# Altium project Sound_Sensor_v3.0.PrjPcb (part 1 of 2)
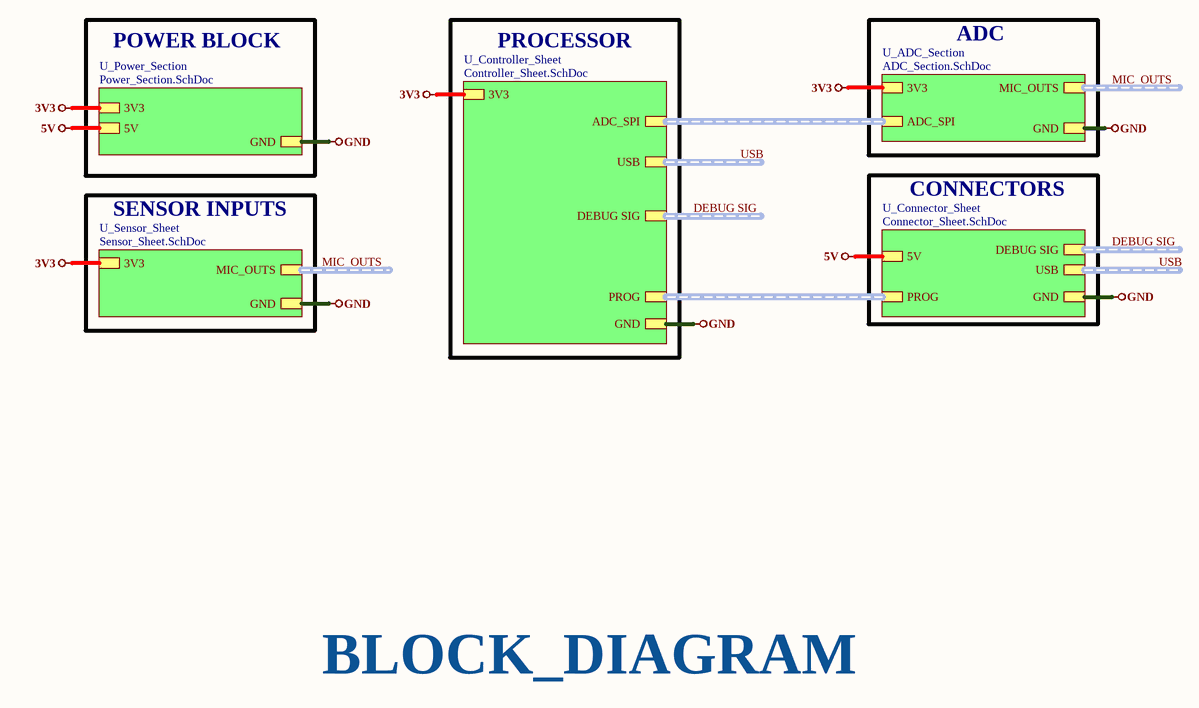
[diagram p0: Top_Sheet.SchDoc]
6 sheets, 83 parts. Net scope: hierarchical (ports join the sheet entries above them; power ports are global).
Board file: Sound_Sensor_v3.0.PcbDoc
Sheets:
  Top_Sheet.SchDoc
    U_Sensor_Sheet = Sensor_Sheet.SchDoc
    U_Power_Section = Power_Section.SchDoc
    U_Controller_Sheet = Controller_Sheet.SchDoc
    U_Connector_Sheet = Connector_Sheet.SchDoc
    U_ADC_Section = ADC_Section.SchDoc

## Sheet Top_Sheet.SchDoc: BLOCK DIAGRAM
size A4; DrawnBy: ENGR ASIM HAYAT; DocumentNumber: 1; SheetNumber: 1; SheetTotal: 6

### Sub-sheets
U_ADC_Section = ADC_Section.SchDoc: MIC_OUTS (harness MIC_OUTS), ADC_SPI (harness ADC_SPI), 3V3, GND
U_Connector_Sheet = Connector_Sheet.SchDoc: PROG (harness PROG), GND, 5V, DEBUG SIG (harness DEBUG SIG), USB (harness USB)
U_Controller_Sheet = Controller_Sheet.SchDoc: PROG (harness PROG), ADC_SPI (harness ADC_SPI), 3V3, GND, DEBUG SIG (harness DEBUG SIG), USB
U_Power_Section = Power_Section.SchDoc: 3V3, GND, 5V
U_Sensor_Sheet = Sensor_Sheet.SchDoc: MIC_OUTS (harness MIC_OUTS), 3V3, GND

### Nets
3V3: sheet U_Sensor_Sheet/3V3, sheet U_Power_Section/3V3, sheet U_Controller_Sheet/3V3, sheet U_ADC_Section/3V3
5V: sheet U_Power_Section/5V, sheet U_Connector_Sheet/5V
GND: sheet U_Sensor_Sheet/GND, sheet U_Power_Section/GND, sheet U_Controller_Sheet/GND, sheet U_Connector_Sheet/GND, sheet U_ADC_Section/GND

### Buses and harness runs
harness DEBUG SIG = sheet U_Connector_Sheet/DEBUG SIG
harness DEBUG SIG = sheet U_Controller_Sheet/DEBUG SIG
harness MIC_OUTS = sheet U_ADC_Section/MIC_OUTS
harness MIC_OUTS = sheet U_Sensor_Sheet/MIC_OUTS
harness sheet U_ADC_Section/ADC_SPI = sheet U_Controller_Sheet/ADC_SPI
harness sheet U_Connector_Sheet/PROG = sheet U_Controller_Sheet/PROG
harness USB = sheet U_Connector_Sheet/USB
harness USB = sheet U_Controller_Sheet/USB

### Notes on the sheet
- POWER BLOCK
- PROCESSOR
- ADC
- SENSOR INPUTS
- CONNECTORS
- BLOCK_DIAGRAM
- File:
- Title:
- Date:
- Page
- Num:
- Total:
- Drawn By: Huzaifa Ali

## Sheet Sensor_Sheet.SchDoc
size A4; DocumentNumber: 3; SheetNumber: 3; SheetTotal: 11
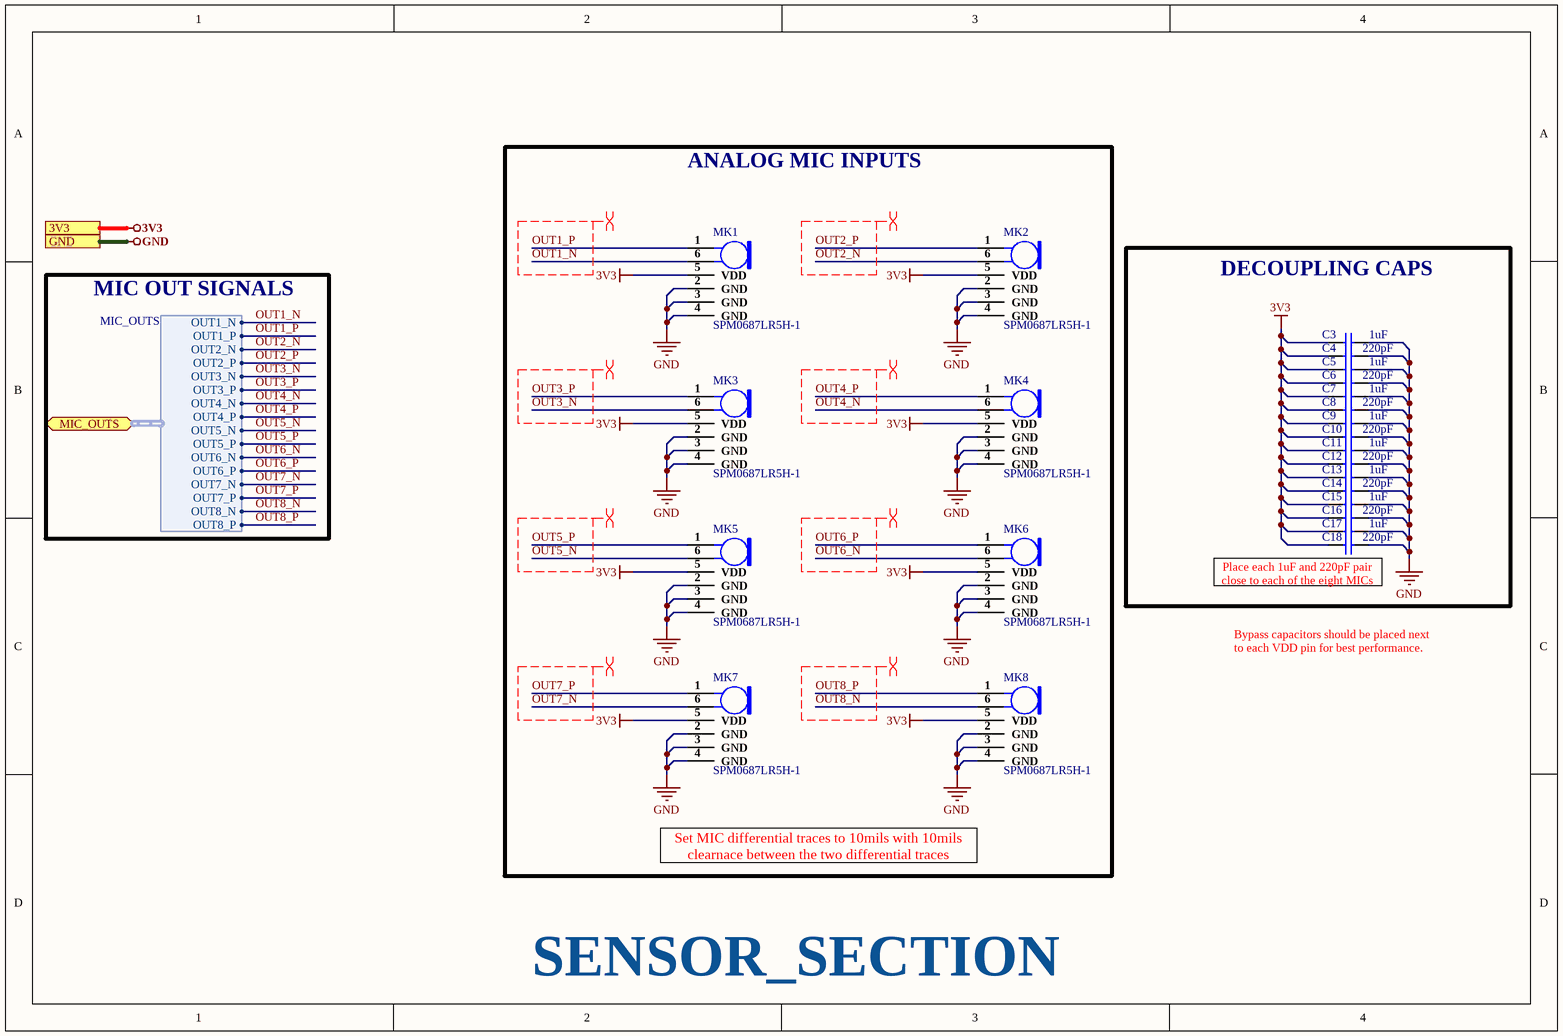
[diagram p1: Sensor_Sheet.SchDoc]

### Parts
C3  1uF  [Cap-0402]
C4  220pF  [Cap 0402]
C5  1uF  [Cap-0402]
C6  220pF  [Cap 0402]
C7  1uF  [Cap-0402]
C8  220pF  [Cap 0402]
C9  1uF  [Cap-0402]
C10  220pF  [Cap 0402]
C11  1uF  [Cap-0402]
C12  220pF  [Cap 0402]
C13  1uF  [Cap-0402]
C14  220pF  [Cap 0402]
C15  1uF  [Cap-0402]
C16  220pF  [Cap 0402]
C17  1uF  [Cap-0402]
C18  220pF  [Cap 0402]
MK1  SPM0687LR5H-1  [SPM0687LR5H-1]
MK2  SPM0687LR5H-1  [SPM0687LR5H-1]
MK3  SPM0687LR5H-1  [SPM0687LR5H-1]
MK4  SPM0687LR5H-1  [SPM0687LR5H-1]
MK5  SPM0687LR5H-1  [SPM0687LR5H-1]
MK6  SPM0687LR5H-1  [SPM0687LR5H-1]
MK7  SPM0687LR5H-1  [SPM0687LR5H-1]
MK8  SPM0687LR5H-1  [SPM0687LR5H-1]

### Blocks framed on the sheet
ANALOG MIC INPUTS: MK1-MK8
DECOUPLING CAPS: C3-C18

### Ports
3V3, GND, MIC_OUTS (bidir, harness MIC_OUTS)

### Harnesses
MIC_OUTS: OUT1_N, OUT1_P, OUT2_N, OUT2_P, OUT3_N, OUT3_P, OUT4_N, OUT4_P, OUT5_N, OUT5_P, OUT6_N, OUT6_P, OUT7_N, OUT7_P, OUT8_N, OUT8_P

### Nets
3V3: C3.1 C4.1 C5.1 C6.1 C7.1 C8.1 C9.1 C10.1 C11.1 C12.1 C13.1 C14.1 C15.1 C16.1 C17.1 C18.1 MK1.5(VDD) MK2.5(VDD) MK3.5(VDD) MK4.5(VDD) MK5.5(VDD) MK6.5(VDD) MK7.5(VDD) MK8.5(VDD) ; port 3V3
GND: C3.2 C4.2 C5.2 C6.2 C7.2 C8.2 C9.2 C10.2 C11.2 C12.2 C13.2 C14.2 C15.2 C16.2 C17.2 C18.2 MK1.2(GND) MK1.3(GND) MK1.4(GND) MK2.2(GND) MK2.3(GND) MK2.4(GND) MK3.2(GND) MK3.3(GND) MK3.4(GND) MK4.2(GND) MK4.3(GND) MK4.4(GND) MK5.2(GND) MK5.3(GND) MK5.4(GND) MK6.2(GND) MK6.3(GND) MK6.4(GND) MK7.2(GND) MK7.3(GND) MK7.4(GND) MK8.2(GND) MK8.3(GND) MK8.4(GND) ; port GND
OUT1_N: MK1.6(OUT-) ; port MIC_OUTS.OUT1_N  [project net MIC_OUTS.OUT1_N]
OUT1_P: MK1.1(OUT+) ; port MIC_OUTS.OUT1_P  [project net MIC_OUTS.OUT1_P]
OUT2_N: MK2.6(OUT-) ; port MIC_OUTS.OUT2_N  [project net MIC_OUTS.OUT2_N]
OUT2_P: MK2.1(OUT+) ; port MIC_OUTS.OUT2_P  [project net MIC_OUTS.OUT2_P]
OUT3_N: MK3.6(OUT-) ; port MIC_OUTS.OUT3_N  [project net MIC_OUTS.OUT3_N]
OUT3_P: MK3.1(OUT+) ; port MIC_OUTS.OUT3_P  [project net MIC_OUTS.OUT3_P]
OUT4_N: MK4.6(OUT-) ; port MIC_OUTS.OUT4_N  [project net MIC_OUTS.OUT4_N]
OUT4_P: MK4.1(OUT+) ; port MIC_OUTS.OUT4_P  [project net MIC_OUTS.OUT4_P]
OUT5_N: MK5.6(OUT-) ; port MIC_OUTS.OUT5_N  [project net MIC_OUTS.OUT5_N]
OUT5_P: MK5.1(OUT+) ; port MIC_OUTS.OUT5_P  [project net MIC_OUTS.OUT5_P]
OUT6_N: MK6.6(OUT-) ; port MIC_OUTS.OUT6_N  [project net MIC_OUTS.OUT6_N]
OUT6_P: MK6.1(OUT+) ; port MIC_OUTS.OUT6_P  [project net MIC_OUTS.OUT6_P]
OUT7_N: MK7.6(OUT-) ; port MIC_OUTS.OUT7_N  [project net MIC_OUTS.OUT7_N]
OUT7_P: MK7.1(OUT+) ; port MIC_OUTS.OUT7_P  [project net MIC_OUTS.OUT7_P]
OUT8_N: MK8.6(OUT-) ; port MIC_OUTS.OUT8_N  [project net MIC_OUTS.OUT8_N]
OUT8_P: MK8.1(OUT+) ; port MIC_OUTS.OUT8_P  [project net MIC_OUTS.OUT8_P]

### Layout directives
differential pair; net class OUT1; differential pair class OUT1_Lines; rule Matched Net Lengths [Tolerance = 20mil]; rule Impedance Constraint [Min = 85.00    Max = 95.00    ]: OUT1_N, OUT1_P
differential pair; net class OUT3; differential pair class OUT3_Lines; rule Matched Net Lengths [Tolerance = 20mil]; rule Impedance Constraint [Min = 85.00    Max = 95.00    ]: OUT3_N, OUT3_P
differential pair; net class OUT5; differential pair class OUT5_Lines; rule Matched Net Lengths [Tolerance = 20mil]; rule Impedance Constraint [Min = 85.00    Max = 95.00    ]: OUT5_N, OUT5_P
differential pair; net class OUT7; differential pair class OUT7_Lines; rule Matched Net Lengths [Tolerance = 20mil]; rule Impedance Constraint [Min = 85.00    Max = 95.00    ]: OUT7_N, OUT7_P
differential pair; net class OUT8; differential pair class OUT8_Lines; rule Matched Net Lengths [Tolerance = 20mil]; rule Impedance Constraint [Min = 85.00    Max = 95.00    ]: OUT8_N, OUT8_P
differential pair; net class OUT6; differential pair class OUT6_Lines; rule Matched Net Lengths [Tolerance = 20mil]; rule Impedance Constraint [Min = 85.00    Max = 95.00    ]: OUT6_N, OUT6_P
differential pair; net class OUT4; differential pair class OUT4_Lines; rule Matched Net Lengths [Tolerance = 20mil]; rule Impedance Constraint [Min = 85.00    Max = 95.00    ]: OUT4_N, OUT4_P
differential pair; net class OUT2; differential pair class OUT2_Lines; rule Matched Net Lengths [Tolerance = 20mil]; rule Impedance Constraint [Min = 85.00    Max = 95.00    ]: OUT2_N, OUT2_P

### Notes on the sheet
- MIC OUT SIGNALS
- (near C18) Place each 1uF and 220pF pair close to each of the eight MICs
- Bypass capacitors should be placed next to each VDD pin for best performance.
- Set MIC differential traces to 10mils with 10mils clearnace between the two differential traces
- SENSOR_SECTION
- File:
- Title:
- Date:
- Page
- Num:
- Total:
- Drawn By: Huzaifa Ali

### Library data of the parts
C3 C5 C7 C9 C11 C13 C15 C17 = CC0402KRX5R8BB105: CAP CER 1UF 25V X5R 0402; Manufacturer: Yageo; Tolerance: 10%; Supplier 1: Mouser; Manufacturer Part Number: CC0402KRX5R8BB105; RoHS: Yes; Category: Ceramic Capacitors; Stock 1: 91975; Pricing 1: 1=0.30000, 10=0.20400, 50=0.20400, 100=0.11600, 1000=0.07200, 10000=0.05900 (USD); Mount: Surface Mount; Case/Package: 0402; Case Code (Metric): 1005; Case Code (Imperial): 0402; Weight: 2.3E-05oz; Min Operating Temperature: -55°C; Max Operating Temperature: 85°C; Packaging: Tape and Reel; Capacitance: 1uF; Voltage Rating: 25V; Dielectric: X5R; Termination: SMD/SMT; Voltage Rating (DC): 25V; Package Quantity: 10000; Length: 0.039inch; Width: 0.02inch; Thickness: 0.022inch; Lead Free: Lead Free; Halogen Free: Halogen Free; RoHS Compliant: Yes; ComponentLink1URL: http://www.mouser.com/ds/2/447/Yageo_UPY-GP_NP0_16V-to-50V_9-358835.pdf?src-supplier=Mouser; ComponentLink1Description: http://www.mouser.com/ds/2/447/Yageo_UPY-GP_NP0_16V-to-50V_9-358835.pdf?src-supplier=Mouser; ComponentLink2URL: http://www.yageo.com/documents/recent/UPY-GPHC_X5R_4V-to-50V_25.pdf?src-supplier=Digi-Key; ComponentLink2Description: http://www.yageo.com/documents/recent/UPY-GPHC_X5R_4V-to-50V_25.pdf?src-supplier=Digi-Key; ComponentLink3URL: https://4donline.ihs.com/images/VipMasterIC/IC/YAGO/YAGO-S-A0006851646/YAGO-S-A0006851646-1.pdf?hkey=6D3A4C79FDBF58556ACFDE234799DDF0&src-supplier=Newark; ComponentLink3Description: https://4donline.ihs.com/images/VipMasterIC/IC/YAGO/YAGO-S-A0006851646/YAGO-S-A0006851646-1.pdf?hkey=6D3A4C79FDBF58556ACFDE234799DDF0&src-supplier=Newark; Supplier Part Number 1: 603-CC402KRX5R8BB105; LCSC Part Number: C326568
C4 C6 C8 C10 C12 C14 C16 C18 = CC0402JRNPO9BN221: CAP CER 220PF 50V C0G/NPO 0402; Manufacturer: Yageo; Dielectric Material: Ceramic; Tolerance: 10%; Dielectric: C0G; Temperature Coefficient: 30ppm/°C; Insulation Resistance: 10GR; Dissipation Factor: 0.1%; Supplier 1: RSComponents; Manufacturer Part Number: CC0402JRNPO9BN221; RoHS: Yes; Category: Ceramic Capacitors; Stock 1: 20000; Pricing 1: 10000=0.00600, 100000=0.00600 (GBP); Mount: Surface Mount; Case/Package: 0402; Number of Pins: 2; Case Code (Metric): 1005; Case Code (Imperial): 0402; Min Operating Temperature: -55°C; Max Operating Temperature: 125°C; Capacitance: 220pF; Package Quantity: 1; Voltage Rating: 50V; Packaging: Tape and Reel; Termination: SMD/SMT; Voltage: 50V; Series: CC; Length: 1mm; Width: 0.02inch; Height: 0.5mm; Thickness: 0.022inch; Depth: 0.5mm; Radiation Hardening: No; RoHS Compliant: Yes; REACH SVHC: No SVHC; Lead Free: Lead Free; ComponentLink1URL: https://datasheet.ciiva.com/11786/0900766b8079c870-11786154.pdf?src-supplier=RSComponents; ComponentLink1Description: https://datasheet.ciiva.com/11786/0900766b8079c870-11786154.pdf?src-supplier=RSComponents; ComponentLink2URL: https://datasheet.ciiva.com/7656/1132289-7656616.pdf?src-supplier=Element14; ComponentLink2Description: https://datasheet.ciiva.com/7656/1132289-7656616.pdf?src-supplier=Element14; ComponentLink3URL: https://datasheet.ciiva.com/8033/1443161-8033609.pdf?src-supplier=Element14; ComponentLink3Description: https://datasheet.ciiva.com/8033/1443161-8033609.pdf?src-supplier=Element14; ComponentLink4URL: https://datasheet.ciiva.com/8033/1443161-8033608.pdf?src-supplier=Element14; ComponentLink4Description: https://datasheet.ciiva.com/8033/1443161-8033608.pdf?src-supplier=Element14; ComponentLink5URL: https://datasheet.ciiva.com/176/mlccorderingcode-176384.pdf?src-supplier=Digi-Key; ComponentLink5Description: https://datasheet.ciiva.com/176/mlccorderingcode-176384.pdf?src-supplier=Digi-Key; ComponentLink6URL: https://datasheet.ciiva.com/176/mlccorderingcode-176383.pdf?src-supplier=Digi-Key; ComponentLink6Description: https://datasheet.ciiva.com/176/mlccorderingcode-176383.pdf?src-supplier=Digi-Key; ComponentLink7URL: https://datasheet.ciiva.com/176/mlccorderingcode-176385.pdf?src-supplier=Digi-Key; ComponentLink7Description: https://datasheet.ciiva.com/176/mlccorderingcode-176385.pdf?src-supplier=Digi-Key; ComponentLink8URL: https://datasheet.ciiva.com/17434/upy-gp-np0-16v-to-50v-8-17434343.pdf?src-supplier=Avnet+Europe; ComponentLink8Description: https://datasheet.ciiva.com/17434/upy-gp-np0-16v-to-50v-8-17434343.pdf?src-supplier=Avnet+Europe; Supplier Part Number 1: 6169284
MK1-MK8 = SPM0687LR5H-1: WINFREY MIC HI SNR/AOP BOT PORT; Manufacturer: Knowles; Shape: Rectangular; Output Type: Analog; Operating Supply Current: 285uA; Item Type: Microphone; Supplier 1: Digi-Key; Manufacturer Part Number: SPM0687LR5H-1; RoHS: Yes; Category: Microphones; Stock 1: 116440; Pricing 1: 1=2.12000, 10=1.75900, 25=1.62560, 50=1.52880, 100=1.43540, 500=1.23212, 1000=1.17611 (USD); Packaging: Cut Tape; Termination: Solder; ComponentLink1URL: https://media.digikey.com/pdf/Data%20Sheets/Knowles%20Acoustics%20PDFs/SPM0687LR5H-1.pdf?src-supplier=Digi-Key; ComponentLink1Description: https://media.digikey.com/pdf/Data%20Sheets/Knowles%20Acoustics%20PDFs/SPM0687LR5H-1.pdf?src-supplier=Digi-Key; Supplier Part Number 1: 423-SPM0687LR5H-1CT-ND; LCSC Part Number: *

## Sheet Power_Section.SchDoc
size A4; DocumentNumber: 2; SheetNumber: 2; SheetTotal: 11
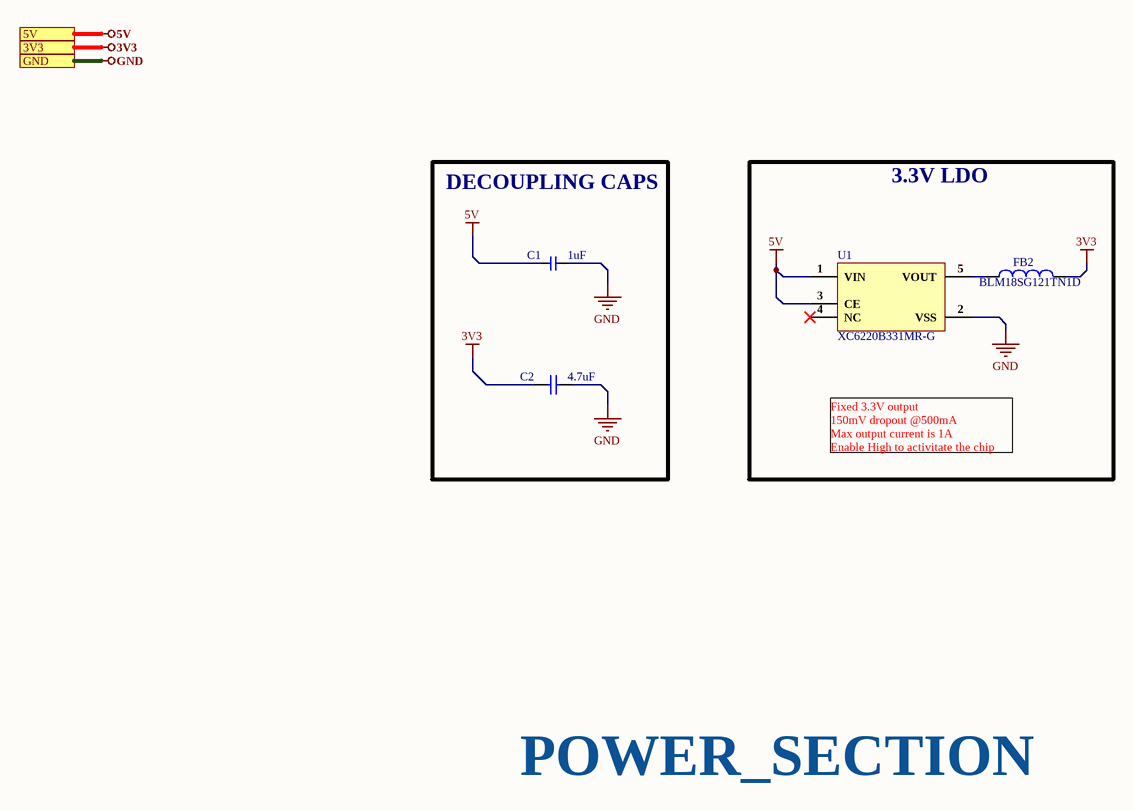
[diagram p2: Power_Section.SchDoc]

### Parts
C1  1uF  [Cap-0603]
C2  4.7uF  [Cap-0603]
FB2  BLM18SG121TN1D  [IND-0603 (1608 Metric)]
U1  XC6220B331MR-G  [SOT-25]

### Blocks framed on the sheet
DECOUPLING CAPS: C1 C2
3.3V LDO: FB2 U1

### Ports
3V3, 5V, GND

### Nets
3V3: C2.1 FB2.2 ; port 3V3
5V: C1.1 U1.1(VIN) U1.3(CE) ; port 5V
GND: C1.2 C2.2 U1.2(VSS) ; port GND
NetFB2_1: FB2.1 U1.5(VOUT)

Not connected (* = marked no-connect by the designer): U1 4(NC)*

### Notes on the sheet
- Fixed 3.3V output
  150mV dropout @500mA
  Max output current is 1A
  Enable High to activitate the chip
- POWER_SECTION
- File:
- Title:
- Date:
- Page
- Num:
- Total:
- Drawn By: Huzaifa Ali

### Library data of the parts
C1 = CC0603KRX5R8BB105: CAP CER 1UF 25V X5R 0603; Manufacturer: Yageo; Tolerance: 10%; Item Type: Capacitor; Supplier 1: Digi-Key; Manufacturer Part Number: CC0603KRX5R8BB105; RoHS: Yes; Category: Ceramic Capacitors; Stock 1: 919939; Pricing 1: 1=0.12000, 10=0.08400, 50=0.04760, 100=0.03940, 500=0.02764, 1000=0.02288 (USD); Mount: Surface Mount; Case/Package: 0603; Case Code (Metric): 1608; Case Code (Imperial): 0603; Min Operating Temperature: -55°C; Max Operating Temperature: 85°C; Packaging: Tape and Reel; Capacitance: 1uF; Voltage Rating: 25V; Dielectric: X5R; Termination: SMD/SMT; Voltage Rating (DC): 25V; Package Quantity: 1; Length: 1.6mm; Width: 0.031inch; Thickness: 0.035inch; Lead Free: Lead Free; Halogen Free: Halogen Free; RoHS Compliant: Yes; ComponentLink1URL: https://datasheet.ciiva.com/176/mlccorderingcode-176785.pdf?src-supplier=Digi-Key; ComponentLink1Description: https://datasheet.ciiva.com/176/mlccorderingcode-176785.pdf?src-supplier=Digi-Key; ComponentLink2URL: https://datasheet.ciiva.com/176/mlccorderingcode-176786.pdf?src-supplier=Digi-Key; ComponentLink2Description: https://datasheet.ciiva.com/176/mlccorderingcode-176786.pdf?src-supplier=Digi-Key; ComponentLink3URL: https://datasheet.ciiva.com/176/mlccorderingcode-176787.pdf?src-supplier=Digi-Key; ComponentLink3Description: https://datasheet.ciiva.com/176/mlccorderingcode-176787.pdf?src-supplier=Digi-Key; Supplier Part Number 1: 311-1445-1-ND; LCSC Part Number: C14664; Number of Pins: 2; Series: CC; Construction: Flat; Height: 0.8mm; Depth: 0.8mm; Radiation Hardening: No; REACH SVHC: No SVHC; ComponentLink4URL: https://datasheet.ciiva.com/17436/upy-gphc-x5r-4v-to-50v-12-17436952.pdf?src-supplier=Avnet+Europe; ComponentLink4Description: https://datasheet.ciiva.com/17436/upy-gphc-x5r-4v-to-50v-12-17436952.pdf?src-supplier=Avnet+Europe; ComponentLink5URL: https://datasheet.ciiva.com/7978/1525783-7978171.pdf?src-supplier=Element14; ComponentLink5Description: https://datasheet.ciiva.com/7978/1525783-7978171.pdf?src-supplier=Element14; ComponentLink6URL: https://datasheet.ciiva.com/11586/upy-gphc-x5r-4v-to-50v-12-11586318.pdf?src-supplier=Avnet; ComponentLink6Description: https://datasheet.ciiva.com/11586/upy-gphc-x5r-4v-to-50v-12-11586318.pdf?src-supplier=Avnet
C2 = CC0603KRX5R7BB475: CAP CER 4.7UF 16V X5R 0603; Manufacturer: Yageo; Tolerance: 10%; Supplier 1: Digi-Key; Manufacturer Part Number: CC0603KRX5R7BB475; RoHS: Yes; Category: Ceramic Capacitors; Stock 1: 547703; Pricing 1: 1=0.20000, 10=0.13800, 50=0.08280, 100=0.06990, 500=0.04784, 1000=0.04233 (USD); Mount: Surface Mount; Case/Package: 0603; Case Code (Imperial): 0603; Case Code (Metric): 1608; Weight: 7.1E-05oz; Min Operating Temperature: -55°C; Max Operating Temperature: 85°C; Capacitance: 4.7uF; Voltage Rating: 16V; Voltage Rating (DC): 16V; Packaging: Tape and Reel; Dielectric: X5R; Termination: SMD/SMT; Resistor Type: Ceramic; Series: CC; Length: 1.6mm; Width: 0.8mm; Height: 0.8mm; Thickness: 0.037inch; Depth: 0.8mm; Lead Free: Lead Free; Halogen Free: Halogen Free; RoHS Compliant: Yes; ComponentLink1URL: http://www.mouser.com/ds/2/447/UPY-GPHC_X5R_4V-to-50V_25-1131599.pdf?src-supplier=Mouser; ComponentLink1Description: http://www.mouser.com/ds/2/447/UPY-GPHC_X5R_4V-to-50V_25-1131599.pdf?src-supplier=Mouser; ComponentLink2URL: http://www.yageo.com/documents/recent/UPY-GPHC_X5R_4V-to-50V_25.pdf?src-supplier=Digi-Key; ComponentLink2Description: http://www.yageo.com/documents/recent/UPY-GPHC_X5R_4V-to-50V_25.pdf?src-supplier=Digi-Key; Supplier Part Number 1: 311-1785-1-ND; LCSC Part Number: C277476
FB2 = BLM18SG121TN1D: FERRITE BEAD 120 OHM 0603 1LN; Manufacturer: Murata; Material: Steel,Ferrite; Tolerance: 25%; Impedance: 120R; DC Resistance (DCR): 25mR; Max DC Current: 3A; Number of Lines: 1; Test Frequency: 100MHz; Shielding: Unshielded; Supplier 1: Arrow Electronics; Manufacturer Part Number: BLM18SG121TN1D; RoHS: Yes; Category: Ferrite Beads and Chips; Stock 1: 82612; Pricing 1: 1=0.12640, 10=0.08350, 25=0.07210, 100=0.05150, 250=0.04730, 500=0.04110, 1000=0.03420, 3000=0.03360, 6000=0.03320, 15000=0.03270, 30000=0.03200, 75000=0.03150 (USD); Case/Package: 0603; Number of Pins: 2; Core Material: Ferrite; Case Code (Metric): 1608; Case Code (Imperial): 0603; Min Operating Temperature: -55°C; Max Operating Temperature: 125°C; Package Quantity: 1; Max Current Rating: 3A; Packaging: Tape and Reel; Current Rating: 3A; Termination: SMD/SMT; Frequency: 100MHz; Number of Circuits: 1; Series: BLM18S; DC Resistance-Max: 25mR; Length: 1.6mm; Width: 0.8mm; Height: 0.8mm; Depth: 0.8mm; Reach SVHC Compliant: Yes; Lead Free: Lead Free; RoHS Compliant: Yes; ComponentLink1URL: https://datasheet.ciiva.com/1012/l0110s0100blm18s-1012624.pdf?src-supplier=Digi-Key; ComponentLink1Description: https://datasheet.ciiva.com/1012/l0110s0100blm18s-1012624.pdf?src-supplier=Digi-Key; ComponentLink2URL: https://datasheet.ciiva.com/11799/0900766b811b5866-11799181.pdf?src-supplier=RSComponents; ComponentLink2Description: https://datasheet.ciiva.com/11799/0900766b811b5866-11799181.pdf?src-supplier=RSComponents; ComponentLink3URL: https://datasheet.ciiva.com/18093/getdatasheetpartid-295885-18093249.pdf?src-supplier=Verical; ComponentLink3Description: https://datasheet.ciiva.com/18093/getdatasheetpartid-295885-18093249.pdf?src-supplier=Verical; ComponentLink4URL: https://datasheet.ciiva.com/41449/001171723-da-01-en-chip-drossel0603-120r-3000ma-1-6x0-8mm-41449353.pdf?src-supplier=Conrad; ComponentLink4Description: https://datasheet.ciiva.com/41449/001171723-da-01-en-chip-drossel0603-120r-3000ma-1-6x0-8mm-41449353.pdf?src-supplier=Conrad; ComponentLink5URL: https://datasheet.ciiva.com/41449/001172312-da-01-en-drossel-0603-120r-1-6x0-8mm-10000st-41449675.pdf?src-supplier=Conrad; ComponentLink5Description: https://datasheet.ciiva.com/41449/001172312-da-01-en-drossel-0603-120r-1-6x0-8mm-10000st-41449675.pdf?src-supplier=Conrad; ComponentLink6URL: https://datasheet.ciiva.com/8021/5151-8021511.pdf?src-supplier=Element14; ComponentLink6Description: https://datasheet.ciiva.com/8021/5151-8021511.pdf?src-supplier=Element14; ComponentLink7URL: https://datasheet.ciiva.com/8021/5151-8021512.pdf?src-supplier=Element14; ComponentLink7Description: https://datasheet.ciiva.com/8021/5151-8021512.pdf?src-supplier=Element14; ComponentLink8URL: https://datasheet.ciiva.com/14122/blm-series-eng-tds-14122906.pdf?src-supplier=Distrelec; ComponentLink8Description: https://datasheet.ciiva.com/14122/blm-series-eng-tds-14122906.pdf?src-supplier=Distrelec; ComponentLink9URL: https://datasheet.ciiva.com/1012/l0110s0100blm18s-1012623.pdf?src-supplier=Digi-Key; ComponentLink9Description: https://datasheet.ciiva.com/1012/l0110s0100blm18s-1012623.pdf?src-supplier=Digi-Key; ComponentLink10URL: https://datasheet.ciiva.com/1012/l0110s0100blm18s-1012625.pdf?src-supplier=Digi-Key; ComponentLink10Description: https://datasheet.ciiva.com/1012/l0110s0100blm18s-1012625.pdf?src-supplier=Digi-Key; ComponentLink11URL: https://datasheet.ciiva.com/16395/l0110s0100blm18s-16395498.pdf?src-supplier=Future+Electronics; ComponentLink11Description: https://datasheet.ciiva.com/16395/l0110s0100blm18s-16395498.pdf?src-supplier=Future+Electronics; Supplier Part Number 1: BLM18SG121TN1D; LCSC Part Number: C113030; Item Type: Ferrite Bead
U1 = XC6220B331MR-G: Linear Voltage Regulator IC Positive Fixed 1 Output 3.3V 1A SOT-25; Manufacturer: Torex; Dropout Voltage: 655mV; Min Input Voltage: 1.6V; Max Input Voltage: 6V; Number of Regulators: 1; Min Current Limit: 1.005A; Supplier 1: Newark; Manufacturer Part Number: XC6220B331MR-G; RoHS: Yes; Category: Voltage Regulators - Linear; Stock 1: 3078; Pricing 1: 1=1.20000, 10=1.08000, 100=0.83900, 500=0.69300, 1000=0.54800 (USD); Mount: Surface Mount; Case/Package: SOT-25; Number of Pins: 5; Min Operating Temperature: -40°C; Max Operating Temperature: 85°C; Package Quantity: 1; Packaging: Tape and Reel; Output Current: 1A; Output Voltage: 3.3V; Nominal Output Voltage: 3.3V; Output Type: Fixed; Series: -; REACH SVHC: No SVHC; RoHS Compliant: Yes; ComponentLink1URL: https://datasheet.ciiva.com/7992/610888-7992813.pdf?src-supplier=Element14; ComponentLink1Description: https://datasheet.ciiva.com/7992/610888-7992813.pdf?src-supplier=Element14; ComponentLink2URL: https://datasheet.ciiva.com/5755/610888-5755886.pdf?src-supplier=Farnell; ComponentLink2Description: https://datasheet.ciiva.com/5755/610888-5755886.pdf?src-supplier=Farnell; ComponentLink3URL: https://datasheet.ciiva.com/2040/xc6220-2040201.pdf?src-supplier=Digi-Key; ComponentLink3Description: https://datasheet.ciiva.com/2040/xc6220-2040201.pdf?src-supplier=Digi-Key; ComponentLink4URL: https://datasheet.ciiva.com/2040/xc6220-2040200.pdf?src-supplier=Digi-Key; ComponentLink4Description: https://datasheet.ciiva.com/2040/xc6220-2040200.pdf?src-supplier=Digi-Key; ComponentLink5URL: https://datasheet.ciiva.com/2040/xc6220-2040202.pdf?src-supplier=Digi-Key; ComponentLink5Description: https://datasheet.ciiva.com/2040/xc6220-2040202.pdf?src-supplier=Digi-Key; Supplier Part Number 1: 84R0738

## Sheet Controller_Sheet.SchDoc
size A4; DocumentNumber: 5; SheetNumber: 5; SheetTotal: 11
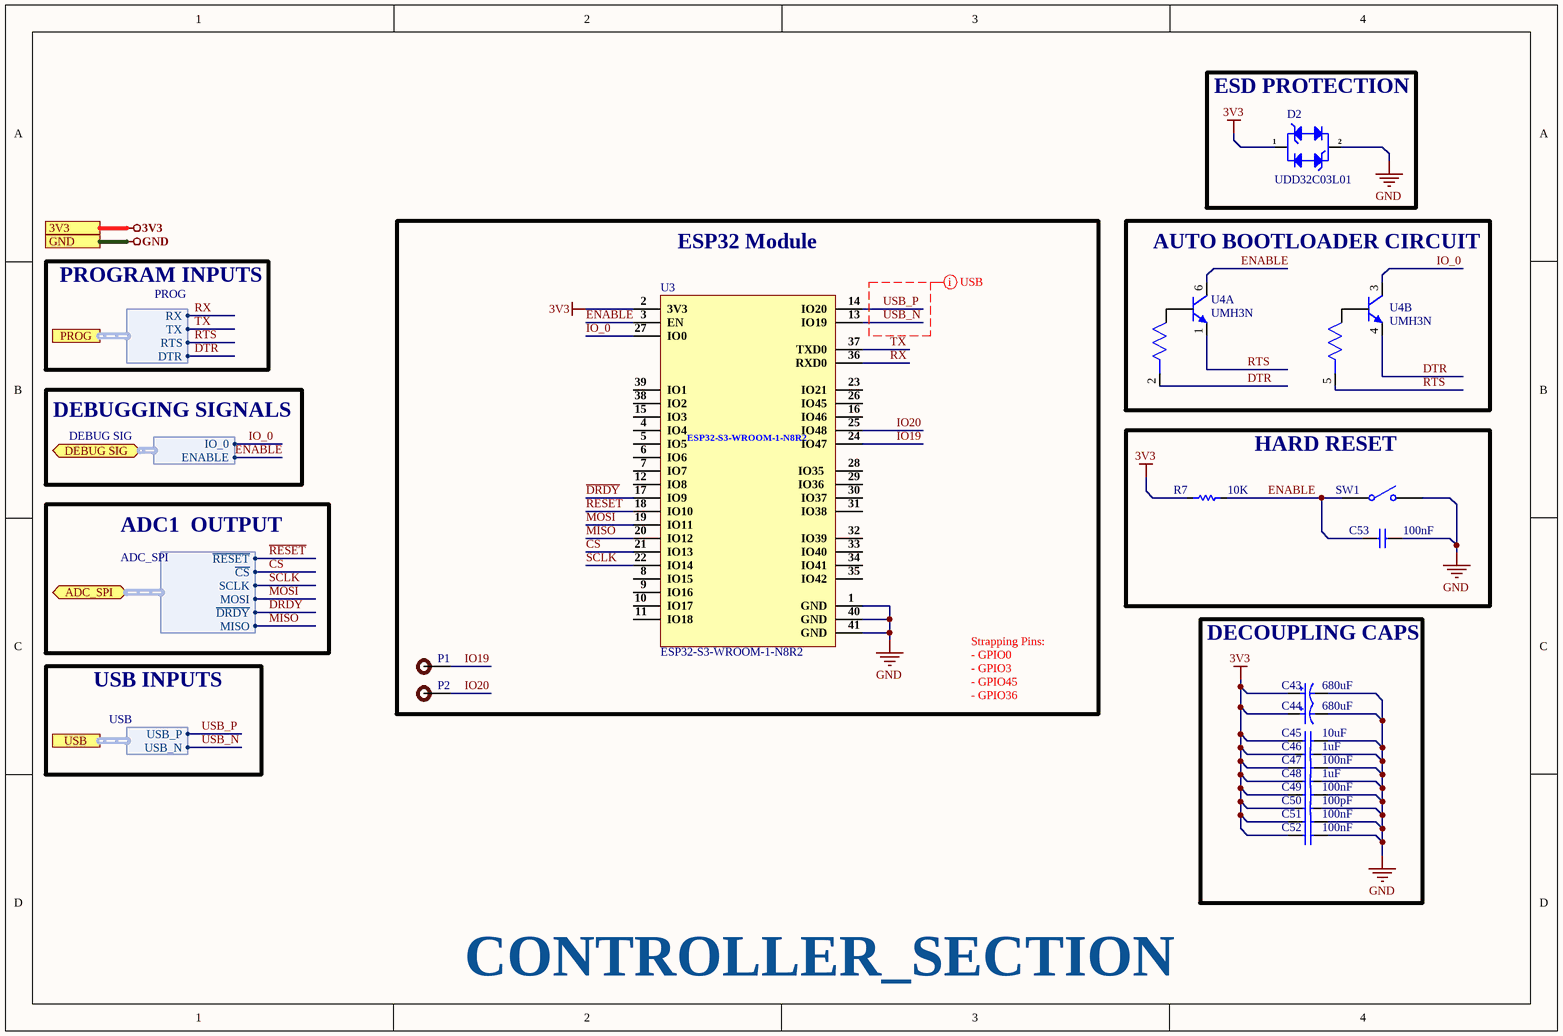
[diagram p3: Controller_Sheet.SchDoc]

### Parts
C43  680uF  [Case-D]
C44  680uF  [Case-D]
C45  10uF  [Cap-0603]
C46  1uF  [Cap-0603]
C47  100nF  [Cap-0603]
C48  1uF  [Cap-0603]
C49  100nF  [Cap-0603]
C50  100pF  [Cap-0603]
C51  100nF  [Cap-0603]
C52  100nF  [Cap-0603]
C53  100nF  [Cap-0603]
D2  UDD32C03L01  [SOD-323]
P1  TEST POINT  [Test-point]  (value not drawn)
P2  TEST POINT  [Test-point]  (value not drawn)
R7  10K  [Res-0603]
SW1  (no value)  [TS-1185EC-C-D-B]
U3  ESP32-S3-WROOM-1-N8R2  [41-SMD Module]
U4  UMH3N  [UMH3N]  (parts A,B of 2)

### Blocks framed on the sheet
ESD PROTECTION: D2
ESP32 Module: P1 P2 U3
AUTO BOOTLOADER CIRCUIT: U4
HARD RESET: C53 R7 SW1
DECOUPLING CAPS: C43-C52

### Ports
3V3, ADC_SPI (bidir, harness ADC_SPI), DEBUG SIG (bidir, harness DEBUG SIG), GND, PROG (harness PROG), USB (harness USB)

### Harnesses
PROG: RX, TX, RTS, DTR
ADC_SPI: ~{RESET}, ~{CS}, SCLK, MOSI, ~{DRDY}, MISO
DEBUG SIG: IO_0, ENABLE
USB: USB_P, USB_N

### Nets
3V3: C43.1 C44.1 C45.1 C46.1 C47.1 C48.1 C49.1 C50.1 C51.1 C52.1 D2.1 R7.1 U3.2(3V3) ; port 3V3
GND: C43.2 C44.2 C45.2 C46.2 C47.2 C48.2 C49.2 C50.2 C51.2 C52.2 C53.2 D2.2 SW1.2 U3.1(GND) U3.40(GND) U3.41(GND) ; port GND
~{CS}: U3.21(IO13) ; port ADC_SPI.~{CS}
~{DRDY}: U3.17(IO9) ; port ADC_SPI.~{DRDY}
~{RESET}: U3.18(IO10) ; port ADC_SPI.~{RESET}
DTR: U4.2 U4.4(E) ; port PROG.DTR
ENABLE: C53.1 R7.2 SW1.1 U3.3(EN) U4.6(C) ; port DEBUG SIG.ENABLE  [project net DEBUG SIG.ENABLE]
IO19: P1.1 U3.24(IO47)
IO20: P2.1 U3.25(IO48)
IO_0: U3.27(IO0) U4.3(C) ; port DEBUG SIG.IO_0  [project net DEBUG SIG.IO_0]
MISO: U3.20(IO12) ; port ADC_SPI.MISO
MOSI: U3.19(IO11) ; port ADC_SPI.MOSI
RTS: U4.1(E) U4.5 ; port PROG.RTS
RX: U3.36(RXD0) ; port PROG.RX
SCLK: U3.22(IO14) ; port ADC_SPI.SCLK
TX: U3.37(TXD0) ; port PROG.TX
USB_N: U3.13(IO19) ; port USB.USB_N  [project net USB.USB_N]
USB_P: U3.14(IO20) ; port USB.USB_P  [project net USB.USB_P]

Not connected (* = marked no-connect by the designer): U3 4(IO4) 5(IO5) 6(IO6) 7(IO7) 8(IO15) 9(IO16) 10(IO17) 11(IO18) 12(IO8) 15(IO3) 16(IO46) 23(IO21) 26(IO45) 28(IO35_) 29(IO36_) 30(IO37) 31(IO38) 32(IO39) 33(IO40) 34(IO41) 35(IO42) 38(IO2) 39(IO1)

### Layout directives
differential pair; net class USB; differential pair class USB_Lines; rule Matched Net Lengths [Tolerance = 20mil]; rule Impedance Constraint [Min = 85.00    Max = 95.00    ]: USB_N, USB_P

### Notes on the sheet
- PROGRAM INPUTS
- DEBUGGING SIGNALS
- ADC1  OUTPUT
- USB INPUTS
- Strapping Pins:
  - GPIO0
  - GPIO3
  - GPIO45
  - GPIO36
- CONTROLLER_SECTION
- File:
- Title:
- Date:
- Page
- Num:
- Total:
- Drawn By: Huzaifa Ali

### Library data of the parts
C43 C44 = 6TPE680MI: CAP TANT POLY 680UF 6.3V 2917; Manufacturer: Panasonic; Tolerance: 20%; ESR (Equivalent Series Resistance): 18mR; Ripple Current: 3.5A; Leakage Current: 428.4uA; Polarity: Polar; Dissipation Factor: 15%; Item Type: Capacitor; Supplier 1: Digi-Key; Manufacturer Part Number: 6TPE680MI; RoHS: Yes; Category: Tantalum Capacitors; Stock 1: 9647; Pricing 1: 1=3.55000, 10=2.86700, 50=2.50240, 100=2.18960, 500=1.66828, 1000=1.45975 (USD); Mount: Surface Mount; Case/Package: 2917; Number of Pins: 4; Case Code (Metric): 7343; Case Code (Imperial): 2917; Min Operating Temperature: -55°C; Max Operating Temperature: 105°C; Packaging: Tape and Reel; Capacitance: 680uF; Package Quantity: 2000; Voltage Rating: 6.3V; Voltage Rating (DC): 6.3V; Termination: SMD/SMT; Voltage: 6.3V; Features: General Purpose; Series: POSCAP™ TPE; Construction: Flat; Length: 7.3mm; Width: 4.3mm; Height: 3.8mm; Height - Seated (Max): 0.157inch; Depth: 4.3mm; Radiation Hardening: No; Reach SVHC Compliant: Yes; Lead Free: Lead Free; RoHS Compliant: Yes; ComponentLink1URL: https://datasheet.ciiva.com/25786/1734363-25786077.pdf?src-supplier=Farnell; ComponentLink1Description: https://datasheet.ciiva.com/25786/1734363-25786077.pdf?src-supplier=Farnell; ComponentLink2URL: https://datasheet.ciiva.com/22745/1734363-22745373.pdf?src-supplier=Element14; ComponentLink2Description: https://datasheet.ciiva.com/22745/1734363-22745373.pdf?src-supplier=Element14; ComponentLink3URL: https://datasheet.ciiva.com/24022/tpe-os-262406-24022136.pdf?src-supplier=Mouser; ComponentLink3Description: https://datasheet.ciiva.com/24022/tpe-os-262406-24022136.pdf?src-supplier=Mouser; ComponentLink4URL: https://datasheet.ciiva.com/26840/getdatasheetpartid-750514-26840938.pdf?src-supplier=Verical; ComponentLink4Description: https://datasheet.ciiva.com/26840/getdatasheetpartid-750514-26840938.pdf?src-supplier=Verical; Supplier Part Number 1: P16633CT-ND; LCSC Part Number: C79115; ComponentLink5Description: New link; ComponentLink5URL: *
C45 = C1608X5R1E106M080AC: CAP CER 10UF 25V X5R 0603; Manufacturer: TDK; Dielectric Material: Ceramic; Tolerance: 20%; Supplier 1: Digi-Key; Manufacturer Part Number: C1608X5R1E106M080AC; Stock 1: 61681; Pricing 1: 1=0.96, 10=0.704, 100=0.483, 500=0.38238, 1000=0.322 (USD); Mount: Surface Mount; Case/Package: 0603; Weight: 7.1E-05oz; Case Code (Imperial): 0603; Case Code (Metric): 1608; Min Operating Temperature: -55°C; Max Operating Temperature: 85°C; Capacitance: 10uF; Packaging: Tape and Reel; Voltage Rating: 25V; Voltage Rating (DC): 25V; Termination: SMD/SMT; Package Quantity: 1; Dielectric: X5R; Composition: Ceramic; Length: 1.6mm; Height: 0.8mm; Width: 0.8mm; Thickness: 0.039inch; Depth: 0.8mm; Lead Free: Lead Free; REACH SVHC: No SVHC; Supplier Part Number 1: 445-9015-1-ND; LCSC Part Number: C2168289
C46 C48 = CC0603KRX5R8BB105: as C1 on sheet Power_Section; Supplier 1: Digi-Key; Manufacturer Part Number: CC0603KRX5R8BB105; RoHS: Yes; Category: Ceramic Capacitors; Stock 1: 919939; Pricing 1: 1=0.12000, 10=0.08400, 50=0.04760, 100=0.03940, 500=0.02764, 1000=0.02288 (USD); Mount: Surface Mount; Case/Package: 0603; Number of Pins: 2; Case Code (Metric): 1608; Case Code (Imperial): 0603; Min Operating Temperature: -55°C; Max Operating Temperature: 85°C; Capacitance: 1uF; Dielectric: X5R; Package Quantity: 1; Voltage Rating: 25V; Packaging: Tape and Reel; Termination: SMD/SMT; Voltage Rating (DC): 25V; Series: CC; Construction: Flat; Length: 1.6mm; Width: 0.031inch; Height: 0.8mm; Thickness: 0.035inch; Depth: 0.8mm; Radiation Hardening: No; REACH SVHC: No SVHC; Lead Free: Lead Free; Halogen Free: Halogen Free; RoHS Compliant: Yes; ComponentLink1URL: https://datasheet.ciiva.com/176/mlccorderingcode-176785.pdf?src-supplier=Digi-Key; ComponentLink1Description: https://datasheet.ciiva.com/176/mlccorderingcode-176785.pdf?src-supplier=Digi-Key; ComponentLink2URL: https://datasheet.ciiva.com/176/mlccorderingcode-176786.pdf?src-supplier=Digi-Key; ComponentLink2Description: https://datasheet.ciiva.com/176/mlccorderingcode-176786.pdf?src-supplier=Digi-Key; ComponentLink3URL: https://datasheet.ciiva.com/176/mlccorderingcode-176787.pdf?src-supplier=Digi-Key; ComponentLink3Description: https://datasheet.ciiva.com/176/mlccorderingcode-176787.pdf?src-supplier=Digi-Key; ComponentLink4URL: https://datasheet.ciiva.com/17436/upy-gphc-x5r-4v-to-50v-12-17436952.pdf?src-supplier=Avnet+Europe; ComponentLink4Description: https://datasheet.ciiva.com/17436/upy-gphc-x5r-4v-to-50v-12-17436952.pdf?src-supplier=Avnet+Europe; ComponentLink5URL: https://datasheet.ciiva.com/7978/1525783-7978171.pdf?src-supplier=Element14; ComponentLink5Description: https://datasheet.ciiva.com/7978/1525783-7978171.pdf?src-supplier=Element14; ComponentLink6URL: https://datasheet.ciiva.com/11586/upy-gphc-x5r-4v-to-50v-12-11586318.pdf?src-supplier=Avnet; ComponentLink6Description: https://datasheet.ciiva.com/11586/upy-gphc-x5r-4v-to-50v-12-11586318.pdf?src-supplier=Avnet; Supplier Part Number 1: 311-1445-1-ND; LCSC Part Number: C14664
C47 C49 C51-C53 = CC0603KRX5R9BB104: CAP CER 0.1UF 50V X5R 0603; Manufacturer: Yageo; Tolerance: 10%; Item Type: Capacitor; Supplier 1: Digi-Key; Manufacturer Part Number: CC0603KRX5R9BB104; RoHS: Yes; Category: Ceramic Capacitors; Stock 1: 152253; Pricing 1: 1=0.10000, 10=0.05200, 50=0.02820, 100=0.02310, 500=0.01648, 1000=0.01294 (USD); Mount: Surface Mount; Case/Package: 0603; Case Code (Imperial): 0603; Case Code (Metric): 1608; Weight: 7.1E-05oz; Min Operating Temperature: -55°C; Max Operating Temperature: 85°C; Capacitance: 100nF; Packaging: Tape and Reel; Voltage Rating: 50V; Dielectric: X5R; Termination: SMD/SMT; Voltage Rating (DC): 50V; Package Quantity: 4000; Length: 0.063inch; Width: 0.031inch; Thickness: 0.035inch; Lead Free: Lead Free; Halogen Free: Halogen Free; ComponentLink1URL: http://www.mouser.com/ds/2/447/Yageo_UPY-GP_NP0_16V-to-50V_9-358835.pdf?src-supplier=Mouser; ComponentLink1Description: http://www.mouser.com/ds/2/447/Yageo_UPY-GP_NP0_16V-to-50V_9-358835.pdf?src-supplier=Mouser; ComponentLink2URL: https://www.yageo.com/upload/media/product/productsearch/datasheet/mlcc/UPY-GPHC_X5R_4V-to-50V_26.pdf?src-supplier=Digi-Key; ComponentLink2Description: https://www.yageo.com/upload/media/product/productsearch/datasheet/mlcc/UPY-GPHC_X5R_4V-to-50V_26.pdf?src-supplier=Digi-Key; ComponentLink3URL: http://www.yageo.com/exep/pages/download/literatures/ProductSelectionGuide%202014_Final_2.pdf?src-supplier=Digi-Key; ComponentLink3Description: http://www.yageo.com/exep/pages/download/literatures/ProductSelectionGuide%202014_Final_2.pdf?src-supplier=Digi-Key; Supplier Part Number 1: 311-4046-1-ND; LCSC Part Number: C110022
C50 = CC0603JRNPO9BN101: CAP CER 100PF 50V C0G/NPO 0603; Manufacturer: Yageo; Tolerance: 5%; Dielectric: C0G; Temperature Coefficient: 30ppm/°C; Insulation Resistance: 100GR; Supplier 1: Arrow Electronics; Manufacturer Part Number: CC0603JRNPO9BN101; RoHS: Yes; Category: Ceramic Capacitors; Stock 1: 10744; Pricing 1: 1=0.06030, 10=0.04400, 25=0.02170, 100=0.01580, 250=0.01330, 500=0.01300, 1000=0.01150, 3000=0.01010, 6000=0.00680 (USD); Mount: Surface Mount; Case/Package: 0603; Number of Pins: 2; Case Code (Imperial): 0603; Case Code (Metric): 1608; Min Operating Temperature: -55°C; Max Operating Temperature: 125°C; Capacitance: 100pF; Voltage: 50V; Voltage Rating: 50V; Voltage Rating (DC): 50V; Packaging: Tape and Reel; Package Quantity: 1; Termination: SMD/SMT; Resistor Type: Ceramic; Series: CC; Length: 1.6mm; Width: 0.8mm; Height: 0.8mm; Thickness: 0.035inch; Depth: 0.8mm; Radiation Hardening: No; RoHS Compliant: Yes; REACH SVHC: Unknown; Lead Free: Lead Free; ComponentLink1URL: https://datasheet.ciiva.com/11786/0900766b8079c870-11786060.pdf?src-supplier=RSComponents; ComponentLink1Description: https://datasheet.ciiva.com/11786/0900766b8079c870-11786060.pdf?src-supplier=RSComponents; ComponentLink2URL: https://datasheet.ciiva.com/7978/1443161-7978127.pdf?src-supplier=Element14; ComponentLink2Description: https://datasheet.ciiva.com/7978/1443161-7978127.pdf?src-supplier=Element14; ComponentLink3URL: https://datasheet.ciiva.com/28450/1443161-28450457.pdf?src-supplier=Element14; ComponentLink3Description: https://datasheet.ciiva.com/28450/1443161-28450457.pdf?src-supplier=Element14; ComponentLink4URL: https://datasheet.ciiva.com/46430/1835847-46430151.pdf?src-supplier=Element14; ComponentLink4Description: https://datasheet.ciiva.com/46430/1835847-46430151.pdf?src-supplier=Element14; ComponentLink5URL: https://datasheet.ciiva.com/144/mlccorderingcode-144629.pdf?src-supplier=Digi-Key; ComponentLink5Description: https://datasheet.ciiva.com/144/mlccorderingcode-144629.pdf?src-supplier=Digi-Key; ComponentLink6URL: https://datasheet.ciiva.com/144/mlccorderingcode-144628.pdf?src-supplier=Digi-Key; ComponentLink6Description: https://datasheet.ciiva.com/144/mlccorderingcode-144628.pdf?src-supplier=Digi-Key; ComponentLink7URL: https://datasheet.ciiva.com/144/mlccorderingcode-144630.pdf?src-supplier=Digi-Key; ComponentLink7Description: https://datasheet.ciiva.com/144/mlccorderingcode-144630.pdf?src-supplier=Digi-Key; ComponentLink8URL: https://datasheet.ciiva.com/11464/upy-gp-np0-16v-to-50v-8-11464725.pdf?src-supplier=Avnet; ComponentLink8Description: https://datasheet.ciiva.com/11464/upy-gp-np0-16v-to-50v-8-11464725.pdf?src-supplier=Avnet; ComponentLink9URL: https://datasheet.ciiva.com/26829/getdatasheetpartid-403525-26829372.pdf?src-supplier=Verical; ComponentLink9Description: https://datasheet.ciiva.com/26829/getdatasheetpartid-403525-26829372.pdf?src-supplier=Verical; Supplier Part Number 1: CC0603JRNPO9BN101; LCSC Part Number: C14665
D2 = UDD32C03L01: 15V 19A 3.3V 4V Bidirectional SOD-323 ESD Protection Devices ROHS; Manufacturer: Brightking; Item Type: ESD Diode; Manufacturer Part Number: UDD32C03L01; ComponentLink1Description: LCSC; ComponentLink1URL: https://lcsc.com/product-detail/span-style-background-color-ff0-ESD-span-Protection-Devices_Brightking-Elec-TAIWAN-UDD32C03L01_C78439.html; LCSC Part Number: C78439
P1 P2 = TEST POINT: Test Point ON
R7 = AC0603JR-0710KL: RES SMD 10K OHM 5% 1/10W 0603; Manufacturer: Yageo; Voltage Rating: 50V; Resistance: 10kR; Power Rating: 100mW; Temperature Coefficient: 100ppm/°C; Item Type: Resistor; Supplier 1: Future Electronics; Manufacturer Part Number: AC0603JR-0710KL; RoHS: Yes; Category: Chip SMD Resistors; Stock 1: 1533000; Pricing 1: 5000=0.00540 (USD); Case/Package: 0603; Case Code (Imperial): 0603; Case Code (Metric): 1608; Size Code: 0603; Min Operating Temperature: -55°C; Max Operating Temperature: 155°C; Packaging: Tape and Reel; Tolerance: 5%; Package Quantity: 1; Resistor Type: Thick Film; Termination: SMD/SMT; Number of Terminations: 2; Max Power Dissipation: 100mW; Features: Moisture Resistant,Automotive AEC-Q200,Anti-Sulfur; Series: AC; Construction: Rectangular; Length: 0.063inch; Width: 0.031inch; Height: 0.022inch; Depth: 0.8mm; Military Standard: Not; Lead Free: Lead Free; RoHS Compliant: Yes; ComponentLink1URL: https://datasheet.ciiva.com/5562/pyu-ac-51-rohs-l-2-5562553.pdf?src-supplier=Mouser; ComponentLink1Description: https://datasheet.ciiva.com/5562/pyu-ac-51-rohs-l-2-5562553.pdf?src-supplier=Mouser; Supplier Part Number 1: 1029044; LCSC Part Number: C140867
SW1 = TS-1185EC-C-D-B: 3mm 2mm Round Button 50mA Top3.65mm SPST 12V SMD Tactile Switches; Manufacturer: XKB; Manufacturer Part No: TS-1185EC-C-D-B; Package: Custom; ComponentLink1Description: LCSC; ComponentLink1URL: https://lcsc.com/product-detail/Tactile-Switches_XKB-Connectivity-TS-1185EC-C-D-B_C318893.html
U3 = ESP32-S3-WROOM-1-N8R2: SMD,18x25.5mm WiFi Modules ROHS; Manufacturer: Espressif Systems; Item Type: Module; Supplier 1: Digi-Key; Manufacturer Part Number: ESP32-S3-WROOM-1-N8R2; RoHS: No; Category: Uncategorized; Supplier Part Number 1: 1965-ESP32-S3-WROOM-1-N8R2-ND; ComponentLink1Description: LCSC; ComponentLink1URL: https://www.lcsc.com/product-detail/WiFi-Modules_Espressif-Systems-ESP32-S3-WROOM-1-N8R2_C2913204.html; LCSC Part Number: C2913204
U4 = UMH3N: 2 NPN pre-biased (Dual) 150mW 100mA 50V SC-70-6(SOT-363) Digital Transistors ROHS; Manufacturer: Changjiang; Manufacturer Part No: UMH3N; Package: SC-70-6(SOT-363); ComponentLink1Description: LCSC; ComponentLink1URL: https://www.lcsc.com/product-detail/Digital-Transistors_Changjiang-Electronics-Tech-CJ-UMH3N_C62892.html